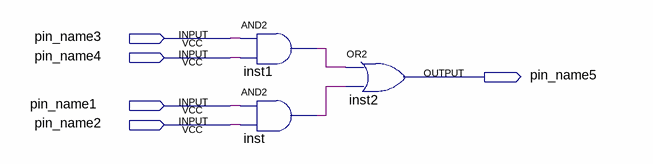
[diagram p0: schematic sheet]
// Quartus schematic newwork.bdf as structural Verilog: 3 symbols, 5 pins
module newwork (
  input  pin_name3,
  input  pin_name4,
  input  pin_name1,
  input  pin_name2,
  output pin_name5
);

  wire inst1_out, inst_out;

  and inst1 (inst1_out, pin_name3, pin_name4);
  and inst (inst_out, pin_name1, pin_name2);
  or inst2 (pin_name5, inst1_out, inst_out);
endmodule
